# Altium schematic sheet DebugPart.SchDoc
size A4
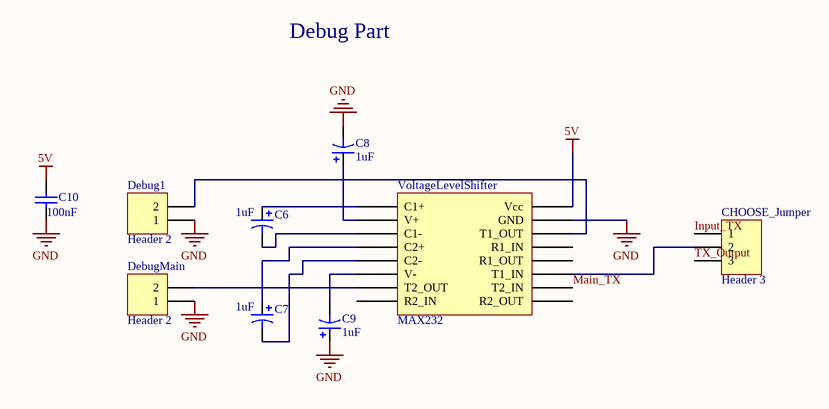
[diagram p0: DebugPart.SchDoc]

## Parts
C6  value 1uF  [Electrolytic_Capacitor]  (hidden comment: Cap Pol1)
C7  value 1uF  [Electrolytic_Capacitor]  (hidden comment: Cap Pol1)
C8  value 1uF  [Electrolytic_Capacitor]  (hidden comment: Cap Pol1)
C9  value 1uF  [Electrolytic_Capacitor]  (hidden comment: Cap Pol1)
C10  value 100nF  [CeramicalCapacitor]  (hidden comment: Cap)
CHOOSE_Jumper  Header 3  [HDR1X3]
Debug1  Header 2  [HDR1X2]
DebugMain  Header 2  [HDR1X2]
VoltageLevelShifter  MAX232  [DIP16]

## Nets
5V: C10.1 VoltageLevelShifter.16(Vcc)
GND: C8.2 C9.1 C10.2 Debug1.1 DebugMain.1 VoltageLevelShifter.15(GND)
Input_TX: CHOOSE_Jumper.1
Main_TX: VoltageLevelShifter.10(T2_IN)
TX_Output: CHOOSE_Jumper.3
NetC6_1: C6.1 VoltageLevelShifter.1(C1+)
NetC6_2: C6.2 VoltageLevelShifter.3(C1-)
NetC7_1: C7.1 VoltageLevelShifter.4(C2+)
NetC7_2: C7.2 VoltageLevelShifter.5(C2-)
NetC8_1: C8.1 VoltageLevelShifter.2(V+)
NetC9_2: C9.2 VoltageLevelShifter.6(V-)
NetCHOOSE_Jumper_2: CHOOSE_Jumper.2 VoltageLevelShifter.11(T1_IN)
NetDebug1_2: Debug1.2 VoltageLevelShifter.14(T1_OUT)
NetDebugMain_2: DebugMain.2 VoltageLevelShifter.7(T2_OUT)

Not connected (* = marked no-connect by the designer): VoltageLevelShifter 8(R2_IN) 9(R2_OUT) 12(R1_OUT) 13(R1_IN)

## Notes on the sheet
- Debug Part

## Library data of the parts
C6-C9 = Cap Pol1: Polarized Capacitor (Radial); Published: 8-Jun-2000; LatestRevisionDate: 17-Jul-2002; LatestRevisionNote: Re-released for DXP Platform.; PackageReference: RB7.6-15; Publisher: Altium Limited; PackageDescription: Polarized Capacitor (Radial); 2 Leads
C10 = Cap: Capacitor; Published: 8-Jun-2000; LatestRevisionDate: 17-Jul-2002; LatestRevisionNote: Re-released for DXP Platform.; PackageReference: RAD-0.3; Publisher: Altium Limited; PackageDescription: Radial Cap, Thru-Hole; 2 Leads; 0.3 in Pin Spacing
CHOOSE_Jumper = Header 3: Header, 3-Pin; LatestRevisionDate: 17-Jul-2002; LatestRevisionNote: Re-released for DXP Platform.; Publisher: Altium Limited
Debug1 DebugMain = Header 2: Header, 2-Pin; LatestRevisionDate: 17-Jul-2002; LatestRevisionNote: Re-released for DXP Platform.; Publisher: Altium Limited
VoltageLevelShifter = MAX3232